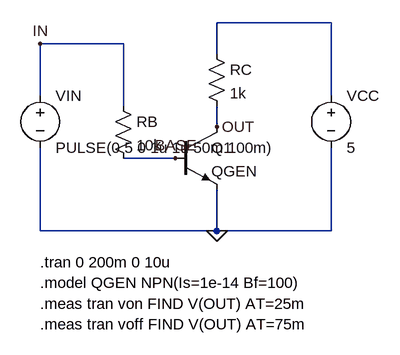
[diagram p0: schematic 03-npn-switch.asc]
03-npn-switch.asc, the LTspice schematic file:
Version 4
SHEET 1 1100 800
WIRE 128 176 128 96
WIRE 128 96 256 96
WIRE 256 96 256 192
WIRE 256 272 336 272
WIRE 400 64 576 64
WIRE 576 64 576 176
WIRE 400 64 400 112
WIRE 400 192 400 224
WIRE 128 256 128 384
WIRE 128 384 400 384
WIRE 400 384 576 384
WIRE 576 384 576 256
WIRE 400 320 400 384
FLAG 400 384 0
FLAG 128 96 IN
FLAG 400 224 OUT
FLAG 336 272 BASE
SYMBOL voltage 128 160 R0
SYMATTR InstName VIN
SYMATTR Value PULSE(0 5 0 1u 1u 50m 100m)
SYMBOL voltage 576 160 R0
SYMATTR InstName VCC
SYMATTR Value 5
SYMBOL res 240 176 R0
SYMATTR InstName RB
SYMATTR Value 10k
SYMBOL res 384 96 R0
SYMATTR InstName RC
SYMATTR Value 1k
SYMBOL npn 336 224 R0
SYMATTR InstName Q1
SYMATTR Value QGEN
TEXT 128 464 Left 2 !.model QGEN NPN(Is=1e-14 Bf=100)
TEXT 128 432 Left 2 !.tran 0 200m 0 10u
TEXT 128 496 Left 2 !.meas tran von FIND V(OUT) AT=25m
TEXT 128 528 Left 2 !.meas tran voff FIND V(OUT) AT=75m

The netlist it stands for:
* 03-npn-switch.asc
VIN IN 0 PULSE(0 5 0 1u 1u 50m 100m)
VCC N001 0 5
RB IN BASE 10k
RC N001 OUT 1k
Q1 OUT BASE 0 0 QGEN
.model NPN NPN
.model PNP PNP
.lib standard.bjt
.model QGEN NPN(Is=1e-14 Bf=100)
.tran 0 200m 0 10u
.meas tran von FIND V(OUT) AT=25m
.meas tran voff FIND V(OUT) AT=75m
.backanno
.end

* Results of the author's LTspice run, read from the files saved beside the schematic
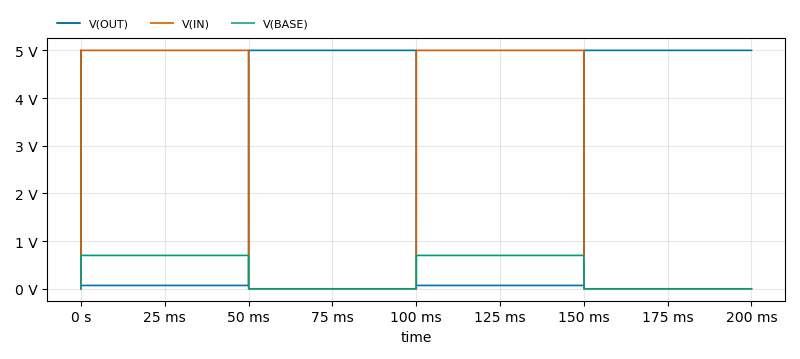
[diagram p1: Transient Analysis of 03-npn-switch.asc, plotted from the saved traces]
* Transient Analysis, 1 run:
*   V(OUT): min 70.4 mV, max 5 V, average 2.535 V, rms 3.536 V, last 5 V
*   V(IN): min 0 V, max 5 V, average 2.5 V, rms 3.536 V, last 0 V
*   V(BASE): min 0 V, max 700 mV, average 350 mV, rms 495 mV, last 0 V